# Altium schematic sheet RS485-UART.SchDoc
size 420 x 297 mm; SheetNumber: 4; SheetTotal: 4
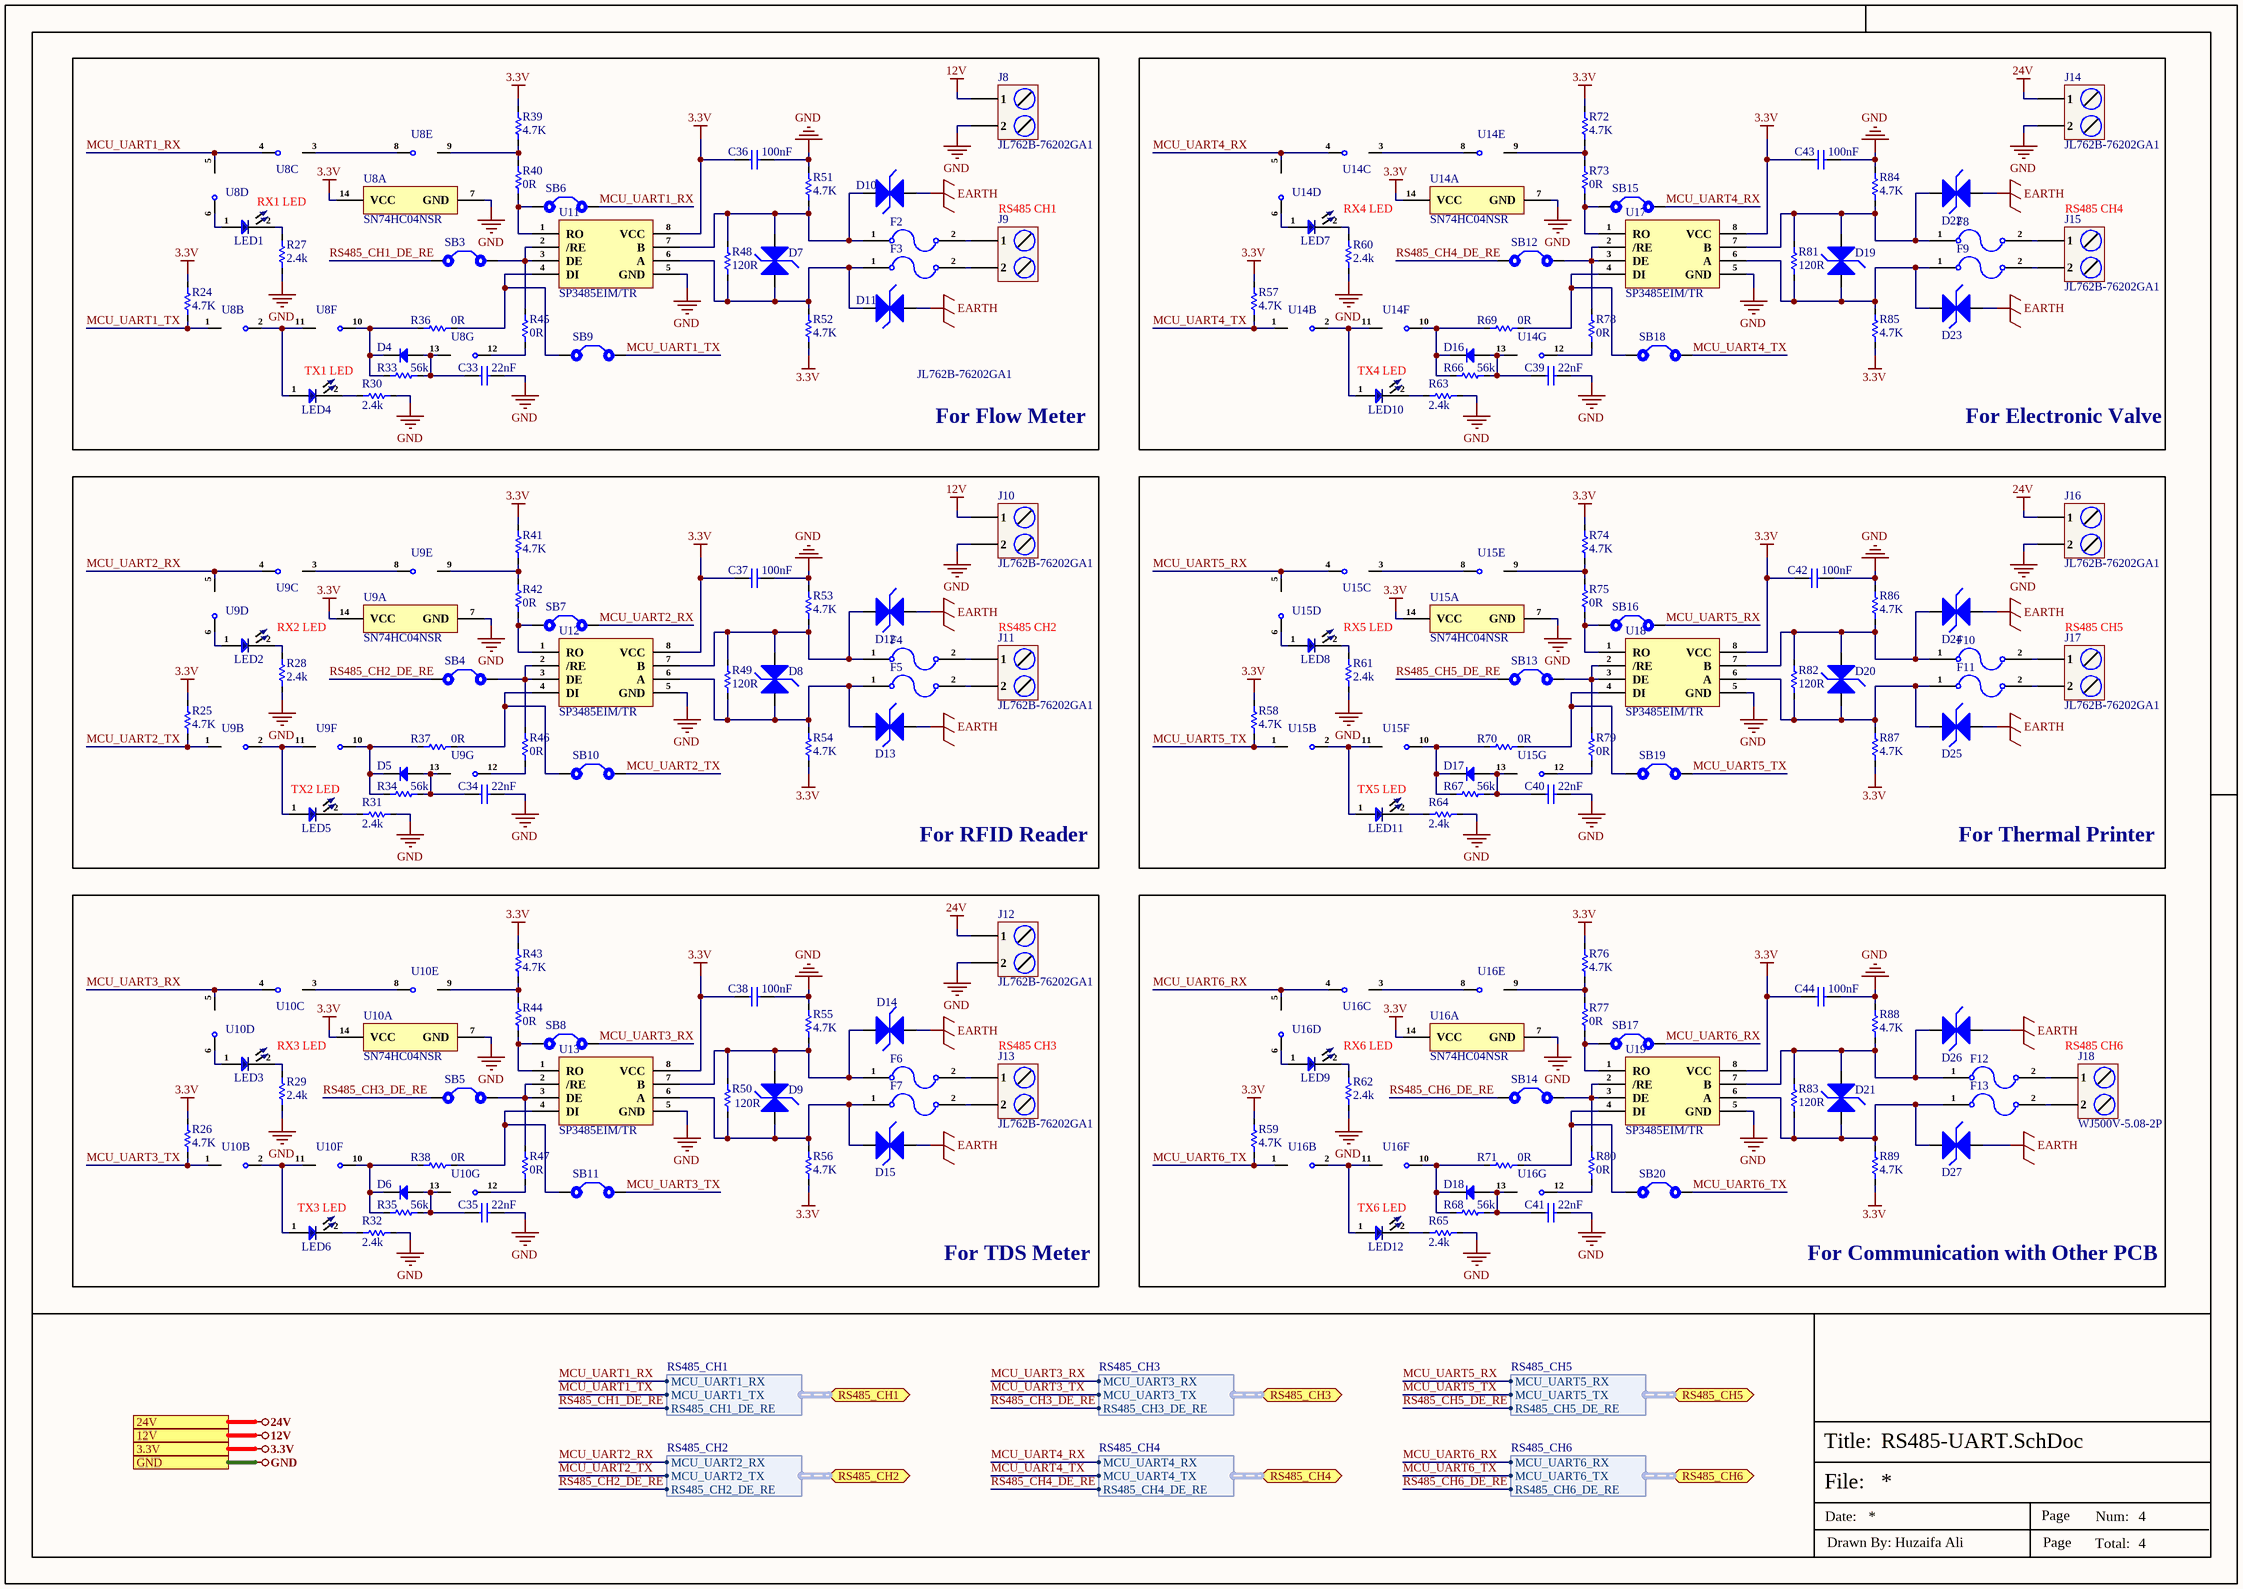
[diagram p0: RS485-UART.SchDoc]

## Parts
C33  22nF  [Cap-0402]
C34  22nF  [Cap-0402]
C35  22nF  [Cap-0402]
C36  100nF  [Cap-0603]
C37  100nF  [Cap-0603]
C38  100nF  [Cap-0603]
C39  22nF  [Cap-0402]
C40  22nF  [Cap-0402]
C41  22nF  [Cap-0402]
C42  100nF  [Cap-0603]
C43  100nF  [Cap-0603]
C44  100nF  [Cap-0603]
D4  1N4148W-7-F  [SOD-123]  (value not drawn)
D5  1N4148W-7-F  [SOD-123]  (value not drawn)
D6  1N4148W-7-F  [SOD-123]  (value not drawn)
D7  SMAJ6.5CA  [SMA]  (value not drawn)
D8  SMAJ6.5CA  [SMA]  (value not drawn)
D9  SMAJ6.5CA  [SMA]  (value not drawn)
D10  SMAJ6.5CA  [SMA]  (value not drawn)
D11  SMAJ6.5CA  [SMA]  (value not drawn)
D12  SMAJ6.5CA  [SMA]  (value not drawn)
D13  SMAJ6.5CA  [SMA]  (value not drawn)
D14  SMAJ6.5CA  [SMA]  (value not drawn)
D15  SMAJ6.5CA  [SMA]  (value not drawn)
D16  1N4148W-7-F  [SOD-123]  (value not drawn)
D17  1N4148W-7-F  [SOD-123]  (value not drawn)
D18  1N4148W-7-F  [SOD-123]  (value not drawn)
D19  SMAJ6.5CA  [SMA]  (value not drawn)
D20  SMAJ6.5CA  [SMA]  (value not drawn)
D21  SMAJ6.5CA  [SMA]  (value not drawn)
D22  SMAJ6.5CA  [SMA]  (value not drawn)
D23  SMAJ6.5CA  [SMA]  (value not drawn)
D24  SMAJ6.5CA  [SMA]  (value not drawn)
D25  SMAJ6.5CA  [SMA]  (value not drawn)
D26  SMAJ6.5CA  [SMA]  (value not drawn)
D27  SMAJ6.5CA  [SMA]  (value not drawn)
F2  MF-MSMF010-2  [Fuse-1812_]  (value not drawn)
F3  MF-MSMF010-2  [Fuse-1812_]  (value not drawn)
F4  MF-MSMF010-2  [Fuse-1812_]  (value not drawn)
F5  MF-MSMF010-2  [Fuse-1812_]  (value not drawn)
F6  MF-MSMF010-2  [Fuse-1812_]  (value not drawn)
F7  MF-MSMF010-2  [Fuse-1812_]  (value not drawn)
F8  MF-MSMF010-2  [Fuse-1812_]  (value not drawn)
F9  MF-MSMF010-2  [Fuse-1812_]  (value not drawn)
F10  MF-MSMF010-2  [Fuse-1812_]  (value not drawn)
F11  MF-MSMF010-2  [Fuse-1812_]  (value not drawn)
F12  MF-MSMF010-2  [Fuse-1812_]  (value not drawn)
F13  MF-MSMF010-2  [Fuse-1812_]  (value not drawn)
J8  JL762B-76202GA1  [JL762B-76202GA1]
J9  JL762B-76202GA1  [JL762B-76202GA1]
J10  JL762B-76202GA1  [JL762B-76202GA1]
J11  JL762B-76202GA1  [JL762B-76202GA1]
J12  JL762B-76202GA1  [JL762B-76202GA1]
J13  JL762B-76202GA1  [JL762B-76202GA1]
J14  JL762B-76202GA1  [JL762B-76202GA1]
J15  JL762B-76202GA1  [JL762B-76202GA1]
J16  JL762B-76202GA1  [JL762B-76202GA1]
J17  JL762B-76202GA1  [JL762B-76202GA1]
J18  WJ500V-5.08-2P  [Terminal Block 2P_]
LED1  Emerald  [LED-0603]  (value not drawn)
LED2  Emerald  [LED-0603]  (value not drawn)
LED3  Emerald  [LED-0603]  (value not drawn)
LED4  Emerald  [LED-0603]  (value not drawn)
LED5  Emerald  [LED-0603]  (value not drawn)
LED6  Emerald  [LED-0603]  (value not drawn)
LED7  Emerald  [LED-0603]  (value not drawn)
LED8  Emerald  [LED-0603]  (value not drawn)
LED9  Emerald  [LED-0603]  (value not drawn)
LED10  Emerald  [LED-0603]  (value not drawn)
LED11  Emerald  [LED-0603]  (value not drawn)
LED12  Emerald  [LED-0603]  (value not drawn)
R24  4.7K  [Res-0402]
R25  4.7K  [Res-0402]
R26  4.7K  [Res-0402]
R27  2.4k  [Res-0402]
R28  2.4k  [Res-0402]
R29  2.4k  [Res-0402]
R30  2.4k  [Res-0402]
R31  2.4k  [Res-0402]
R32  2.4k  [Res-0402]
R33  56k  [Res-0402]
R34  56k  [Res-0402]
R35  56k  [Res-0402]
R36  0R  [Res-0402]
R37  0R  [Res-0402]
R38  0R  [Res-0402]
R39  4.7K  [Res-0402]
R40  0R  [Res-0402]
R41  4.7K  [Res-0402]
R42  0R  [Res-0402]
R43  4.7K  [Res-0402]
R44  0R  [Res-0402]
R45  0R  [Res-0402]
R46  0R  [Res-0402]
R47  0R  [Res-0402]
R48  120R  [Res-0603]
R49  120R  [Res-0603]
R50  120R  [Res-0603]
R51  4.7K  [Res-0402]
R52  4.7K  [Res-0402]
R53  4.7K  [Res-0402]
R54  4.7K  [Res-0402]
R55  4.7K  [Res-0402]
R56  4.7K  [Res-0402]
R57  4.7K  [Res-0402]
R58  4.7K  [Res-0402]
R59  4.7K  [Res-0402]
R60  2.4k  [Res-0402]
R61  2.4k  [Res-0402]
R62  2.4k  [Res-0402]
R63  2.4k  [Res-0402]
R64  2.4k  [Res-0402]
R65  2.4k  [Res-0402]
R66  56k  [Res-0402]
R67  56k  [Res-0402]
R68  56k  [Res-0402]
R69  0R  [Res-0402]
R70  0R  [Res-0402]
R71  0R  [Res-0402]
R72  4.7K  [Res-0402]
R73  0R  [Res-0402]
R74  4.7K  [Res-0402]
R75  0R  [Res-0402]
R76  4.7K  [Res-0402]
R77  0R  [Res-0402]
R78  0R  [Res-0402]
R79  0R  [Res-0402]
R80  0R  [Res-0402]
R81  120R  [Res-0603]
R82  120R  [Res-0603]
R83  120R  [Res-0603]
R84  4.7K  [Res-0402]
R85  4.7K  [Res-0402]
R86  4.7K  [Res-0402]
R87  4.7K  [Res-0402]
R88  4.7K  [Res-0402]
R89  4.7K  [Res-0402]
SB3  Solder Bridge 0402  [Solder Bridge 0402]  (value not drawn)
SB4  Solder Bridge 0402  [Solder Bridge 0402]  (value not drawn)
SB5  Solder Bridge 0402  [Solder Bridge 0402]  (value not drawn)
SB6  Solder Bridge 0402  [Solder Bridge 0402]  (value not drawn)
SB7  Solder Bridge 0402  [Solder Bridge 0402]  (value not drawn)
SB8  Solder Bridge 0402  [Solder Bridge 0402]  (value not drawn)
SB9  Solder Bridge 0402  [Solder Bridge 0402]  (value not drawn)
SB10  Solder Bridge 0402  [Solder Bridge 0402]  (value not drawn)
SB11  Solder Bridge 0402  [Solder Bridge 0402]  (value not drawn)
SB12  Solder Bridge 0402  [Solder Bridge 0402]  (value not drawn)
SB13  Solder Bridge 0402  [Solder Bridge 0402]  (value not drawn)
SB14  Solder Bridge 0402  [Solder Bridge 0402]  (value not drawn)
SB15  Solder Bridge 0402  [Solder Bridge 0402]  (value not drawn)
SB16  Solder Bridge 0402  [Solder Bridge 0402]  (value not drawn)
SB17  Solder Bridge 0402  [Solder Bridge 0402]  (value not drawn)
SB18  Solder Bridge 0402  [Solder Bridge 0402]  (value not drawn)
SB19  Solder Bridge 0402  [Solder Bridge 0402]  (value not drawn)
SB20  Solder Bridge 0402  [Solder Bridge 0402]  (value not drawn)
U8  SN74HC04NSR  [14-SOIC]  (parts A,B,C,D,E,F,G of 7)
U9  SN74HC04NSR  [14-SOIC]  (parts A,B,C,D,E,F,G of 7)
U10  SN74HC04NSR  [14-SOIC]  (parts A,B,C,D,E,F,G of 7)
U11  SP3485EIM/TR  [SOP-8]
U12  SP3485EIM/TR  [SOP-8]
U13  SP3485EIM/TR  [SOP-8]
U14  SN74HC04NSR  [14-SOIC]  (parts A,B,C,D,E,F,G of 7)
U15  SN74HC04NSR  [14-SOIC]  (parts A,B,C,D,E,F,G of 7)
U16  SN74HC04NSR  [14-SOIC]  (parts A,B,C,D,E,F,G of 7)
U17  SP3485EIM/TR  [SOP-8]
U18  SP3485EIM/TR  [SOP-8]
U19  SP3485EIM/TR  [SOP-8]

## Blocks framed on the sheet
For Flow Meter: C33 C36 D4 D7 D10 D11 F2 F3 J8 J9 LED1 LED4 R24 R27 R30 R33 R36 R39 R40 R45 R48 R51 R52 SB3 SB6 SB9 U8 U11
For Electronic Valve: C39 C43 D16 D19 D22 D23 F8 F9 J14 J15 LED7 LED10 R57 R60 R63 R66 R69 R72 R73 R78 R81 R84 R85 SB12 SB15 SB18 U14 U17
For RFID Reader: C34 C37 D5 D8 D12 D13 F4 F5 J10 J11 LED2 LED5 R25 R28 R31 R34 R37 R41 R42 R46 R49 R53 R54 SB4 SB7 SB10 U9 U12
For Thermal Printer: C40 C42 D17 D20 D24 D25 F10 F11 J16 J17 LED8 LED11 R58 R61 R64 R67 R70 R74 R75 R79 R82 R86 R87 SB13 SB16 SB19 U15 U18
For TDS Meter: C35 C38 D6 D9 D14 D15 F6 F7 J12 J13 LED3 LED6 R26 R29 R32 R35 R38 R43 R44 R47 R50 R55 R56 SB5 SB8 SB11 U10 U13
For Communication with Other PCB: C41 C44 D18 D21 D26 D27 F12 F13 J18 LED9 LED12 R59 R62 R65 R68 R71 R76 R77 R80 R83 R88 R89 SB14 SB17 SB20 U16 U19

## Ports
3.3V, 12V, 24V, GND, RS485_CH1 (bidir, harness RS485_CH1), RS485_CH2 (bidir, harness RS485_CH2), RS485_CH3 (bidir, harness RS485_CH3), RS485_CH4 (bidir, harness RS485_CH4), RS485_CH5 (bidir, harness RS485_CH5), RS485_CH6 (bidir, harness RS485_CH6)

## Harnesses
RS485_CH1: MCU_UART1_RX, MCU_UART1_TX, RS485_CH1_DE_RE
RS485_CH2: MCU_UART2_RX, MCU_UART2_TX, RS485_CH2_DE_RE
RS485_CH3: MCU_UART3_RX, MCU_UART3_TX, RS485_CH3_DE_RE
RS485_CH4: MCU_UART4_RX, MCU_UART4_TX, RS485_CH4_DE_RE
RS485_CH5: MCU_UART5_RX, MCU_UART5_TX, RS485_CH5_DE_RE
RS485_CH6: MCU_UART6_RX, MCU_UART6_TX, RS485_CH6_DE_RE

## Nets
3.3V: C36.2 C37.2 C38.2 C42.2 C43.2 C44.2 R24.2 R25.2 R26.2 R39.2 R41.2 R43.2 R52.1 R54.1 R56.1 R57.2 R58.2 R59.2 R72.2 R74.2 R76.2 R85.1 R87.1 R89.1 U8.14(VCC) U9.14(VCC) U10.14(VCC) U11.8(VCC) U12.8(VCC) U13.8(VCC) U14.14(VCC) U15.14(VCC) U16.14(VCC) U17.8(VCC) U18.8(VCC) U19.8(VCC) ; port 3.3V
12V: J8.1 J10.1 ; port 12V
24V: J12.1 J14.1 J16.1 ; port 24V
EARTH: D10.1(A) D11.1(A) D12.1(A) D13.1(A) D14.1(A) D15.1(A) D22.1(A) D23.1(A) D24.1(A) D25.1(A) D26.1(A) D27.1(A)
GND: C33.1 C34.1 C35.1 C36.1 C37.1 C38.1 C39.1 C40.1 C41.1 C42.1 C43.1 C44.1 J8.2 J10.2 J12.2 J14.2 J16.2 R27.1 R28.1 R29.1 R30.1 R31.1 R32.1 R51.2 R53.2 R55.2 R60.1 R61.1 R62.1 R63.1 R64.1 R65.1 R84.2 R86.2 R88.2 U8.7(GND) U9.7(GND) U10.7(GND) U11.5(GND) U12.5(GND) U13.5(GND) U14.7(GND) U15.7(GND) U16.7(GND) U17.5(GND) U18.5(GND) U19.5(GND) ; port GND
MCU_UART1_RX: SB6.2 U8.4(2Y) U8.5(3A) ; port RS485_CH1.MCU_UART1_RX
MCU_UART1_TX: R24.1 SB9.2 U8.1(1A) ; port RS485_CH1.MCU_UART1_TX
MCU_UART2_RX: SB7.2 U9.4(2Y) U9.5(3A) ; port RS485_CH2.MCU_UART2_RX
MCU_UART2_TX: R25.1 SB10.2 U9.1(1A) ; port RS485_CH2.MCU_UART2_TX
MCU_UART3_RX: SB8.2 U10.4(2Y) U10.5(3A) ; port RS485_CH3.MCU_UART3_RX
MCU_UART3_TX: R26.1 SB11.2 U10.1(1A) ; port RS485_CH3.MCU_UART3_TX
MCU_UART4_RX: SB15.2 U14.4(2Y) U14.5(3A) ; port RS485_CH4.MCU_UART4_RX
MCU_UART4_TX: R57.1 SB18.2 U14.1(1A) ; port RS485_CH4.MCU_UART4_TX
MCU_UART5_RX: SB16.2 U15.4(2Y) U15.5(3A) ; port RS485_CH5.MCU_UART5_RX
MCU_UART5_TX: R58.1 SB19.2 U15.1(1A) ; port RS485_CH5.MCU_UART5_TX
MCU_UART6_RX: SB17.2 U16.4(2Y) U16.5(3A) ; port RS485_CH6.MCU_UART6_RX
MCU_UART6_TX: R59.1 SB20.2 U16.1(1A) ; port RS485_CH6.MCU_UART6_TX
RS485_CH1_DE_RE: SB3.1 ; port RS485_CH1.RS485_CH1_DE_RE
RS485_CH2_DE_RE: SB4.1 ; port RS485_CH2.RS485_CH2_DE_RE
RS485_CH3_DE_RE: SB5.1 ; port RS485_CH3.RS485_CH3_DE_RE
RS485_CH4_DE_RE: SB12.1 ; port RS485_CH4.RS485_CH4_DE_RE
RS485_CH5_DE_RE: SB13.1 ; port RS485_CH5.RS485_CH5_DE_RE
RS485_CH6_DE_RE: SB14.1 ; port RS485_CH6.RS485_CH6_DE_RE
NetC33_2: C33.2 D4.1(A) R33.2 U8.13(6A)
NetC34_2: C34.2 D5.1(A) R34.2 U9.13(6A)
NetC35_2: C35.2 D6.1(A) R35.2 U10.13(6A)
NetC39_2: C39.2 D16.1(A) R66.2 U14.13(6A)
NetC40_2: C40.2 D17.1(A) R67.2 U15.13(6A)
NetC41_2: C41.2 D18.1(A) R68.2 U16.13(6A)
NetD4_2: D4.2(K) R33.1 R36.2 U8.10(5Y)
NetD5_2: D5.2(K) R34.1 R37.2 U9.10(5Y)
NetD6_2: D6.2(K) R35.1 R38.2 U10.10(5Y)
NetD7_1: D7.1(A) D11.2(A) F3.1 R48.1 R52.2 U11.6(A)
NetD7_2: D7.2(A) D10.2(A) F2.1 R48.2 R51.1 U11.7(B)
NetD8_1: D8.1(A) D13.2(A) F5.1 R49.1 R54.2 U12.6(A)
NetD8_2: D8.2(A) D12.2(A) F4.1 R49.2 R53.1 U12.7(B)
NetD9_1: D9.1(A) D15.2(A) F7.1 R50.1 R56.2 U13.6(A)
NetD9_2: D9.2(A) D14.2(A) F6.1 R50.2 R55.1 U13.7(B)
NetD16_2: D16.2(K) R66.1 R69.2 U14.10(5Y)
NetD17_2: D17.2(K) R67.1 R70.2 U15.10(5Y)
NetD18_2: D18.2(K) R68.1 R71.2 U16.10(5Y)
NetD19_1: D19.1(A) D23.2(A) F9.1 R81.1 R85.2 U17.6(A)
NetD19_2: D19.2(A) D22.2(A) F8.1 R81.2 R84.1 U17.7(B)
NetD20_1: D20.1(A) D25.2(A) F11.1 R82.1 R87.2 U18.6(A)
NetD20_2: D20.2(A) D24.2(A) F10.1 R82.2 R86.1 U18.7(B)
NetD21_1: D21.1(A) D27.2(A) F13.1 R83.1 R89.2 U19.6(A)
NetD21_2: D21.2(A) D26.2(A) F12.1 R83.2 R88.1 U19.7(B)
NetF2_2: F2.2 J9.1
NetF3_2: F3.2 J9.2
NetF4_2: F4.2 J11.1
NetF5_2: F5.2 J11.2
NetF6_2: F6.2 J13.1
NetF7_2: F7.2 J13.2
NetF8_2: F8.2 J15.1
NetF9_2: F9.2 J15.2
NetF10_2: F10.2 J17.1
NetF11_2: F11.2 J17.2
NetF12_2: F12.2 J18.1
NetF13_2: F13.2 J18.2
NetLED1_1: LED1.1 U8.6(3Y)
NetLED1_2: LED1.2 R27.2
NetLED2_1: LED2.1 U9.6(3Y)
NetLED2_2: LED2.2 R28.2
NetLED3_1: LED3.1 U10.6(3Y)
NetLED3_2: LED3.2 R29.2
NetLED4_1: LED4.1 U8.2(1Y) U8.11(5A)
NetLED4_2: LED4.2 R30.2
NetLED5_1: LED5.1 U9.2(1Y) U9.11(5A)
NetLED5_2: LED5.2 R31.2
NetLED6_1: LED6.1 U10.2(1Y) U10.11(5A)
NetLED6_2: LED6.2 R32.2
NetLED7_1: LED7.1 U14.6(3Y)
NetLED7_2: LED7.2 R60.2
NetLED8_1: LED8.1 U15.6(3Y)
NetLED8_2: LED8.2 R61.2
NetLED9_1: LED9.1 U16.6(3Y)
NetLED9_2: LED9.2 R62.2
NetLED10_1: LED10.1 U14.2(1Y) U14.11(5A)
NetLED10_2: LED10.2 R63.2
NetLED11_1: LED11.1 U15.2(1Y) U15.11(5A)
NetLED11_2: LED11.2 R64.2
NetLED12_1: LED12.1 U16.2(1Y) U16.11(5A)
NetLED12_2: LED12.2 R65.2
NetR36_1: R36.1 SB9.1 U11.4(DI)
NetR37_1: R37.1 SB10.1 U12.4(DI)
NetR38_1: R38.1 SB11.1 U13.4(DI)
NetR39_1: R39.1 R40.1 U8.9(4A)
NetR40_2: R40.2 SB6.1 U11.1(RO)
NetR41_1: R41.1 R42.1 U9.9(4A)
NetR42_2: R42.2 SB7.1 U12.1(RO)
NetR43_1: R43.1 R44.1 U10.9(4A)
NetR44_2: R44.2 SB8.1 U13.1(RO)
NetR45_1: R45.1 U8.12(6Y)
NetR45_2: R45.2 SB3.2 U11.2(/RE) U11.3(DE)
NetR46_1: R46.1 U9.12(6Y)
NetR46_2: R46.2 SB4.2 U12.2(/RE) U12.3(DE)
NetR47_1: R47.1 U10.12(6Y)
NetR47_2: R47.2 SB5.2 U13.2(/RE) U13.3(DE)
NetR69_1: R69.1 SB18.1 U17.4(DI)
NetR70_1: R70.1 SB19.1 U18.4(DI)
NetR71_1: R71.1 SB20.1 U19.4(DI)
NetR72_1: R72.1 R73.1 U14.9(4A)
NetR73_2: R73.2 SB15.1 U17.1(RO)
NetR74_1: R74.1 R75.1 U15.9(4A)
NetR75_2: R75.2 SB16.1 U18.1(RO)
NetR76_1: R76.1 R77.1 U16.9(4A)
NetR77_2: R77.2 SB17.1 U19.1(RO)
NetR78_1: R78.1 U14.12(6Y)
NetR78_2: R78.2 SB12.2 U17.2(/RE) U17.3(DE)
NetR79_1: R79.1 U15.12(6Y)
NetR79_2: R79.2 SB13.2 U18.2(/RE) U18.3(DE)
NetR80_1: R80.1 U16.12(6Y)
NetR80_2: R80.2 SB14.2 U19.2(/RE) U19.3(DE)
NetU8_3: U8.3(2A) U8.8(4Y)
NetU9_3: U9.3(2A) U9.8(4Y)
NetU10_3: U10.3(2A) U10.8(4Y)
NetU14_3: U14.3(2A) U14.8(4Y)
NetU15_3: U15.3(2A) U15.8(4Y)
NetU16_3: U16.3(2A) U16.8(4Y)

## Notes on the sheet
- RX1 LED
- (near J9) RS485 CH1
- RX4 LED
- (near J15) RS485 CH4
- TX1 LED
- TX4 LED
- RX2 LED
- (near J11) RS485 CH2
- RX5 LED
- (near J17) RS485 CH5
- TX2 LED
- TX5 LED
- RX3 LED
- (near J13) RS485 CH3
- RX6 LED
- (near J18) RS485 CH6
- TX3 LED
- TX6 LED
- File:
- Title:
- Date:
- Page
- Num:
- Total:
- Drawn By: Huzaifa Ali

## Library data of the parts
C33-C35 C39-C41 = CC0402KRX5R7BB223: CAP CER 0.022UF 16V X5R 0402; Manufacturer: Yageo; Tolerance: 10%; Supplier 1: Mouser; Manufacturer Part Number: CC0402KRX5R7BB223; RoHS: Yes; Category: Ceramic Capacitors; Stock 1: 31160; Pricing 1: 1=0.10000, 10=0.05600, 50=0.05600, 100=0.02500, 1000=0.01400, 10000=0.01000 (USD); Mount: Surface Mount; Case/Package: 0402; Case Code (Metric): 1005; Case Code (Imperial): 0402; Min Operating Temperature: -55°C; Max Operating Temperature: 85°C; Packaging: Tape and Reel; Capacitance: 22nF; Voltage Rating: 16V; Voltage Rating (DC): 16V; Dielectric: X5R; Length: 0.039inch; Width: 0.02inch; Thickness: 0.022inch; Lead Free: Lead Free; Halogen Free: Halogen Free; RoHS Compliant: Yes; ComponentLink1URL: http://www.yageo.com/exep/pages/download/literatures/ProductSelectionGuide%202014_Final_2.pdf?src-supplier=Digi-Key; ComponentLink1Description: http://www.yageo.com/exep/pages/download/literatures/ProductSelectionGuide%202014_Final_2.pdf?src-supplier=Digi-Key; ComponentLink2URL: http://www.yageo.com/documents/recent/UPY-GPHC_X5R_4V-to-50V_25.pdf?src-supplier=Digi-Key; ComponentLink2Description: http://www.yageo.com/documents/recent/UPY-GPHC_X5R_4V-to-50V_25.pdf?src-supplier=Digi-Key; Supplier Part Number 1: 603-CC402KRX5R7BB223; LCSC Part Number: C541399
C36-C38 C42-C44 = CC0603KRX5R9BB104: CAP CER 0.1UF 50V X5R 0603; Manufacturer: Yageo; Tolerance: 10%; Item Type: Capacitor; Supplier 1: Digi-Key; Manufacturer Part Number: CC0603KRX5R9BB104; RoHS: Yes; Category: Ceramic Capacitors; Stock 1: 152253; Pricing 1: 1=0.10000, 10=0.05200, 50=0.02820, 100=0.02310, 500=0.01648, 1000=0.01294 (USD); Mount: Surface Mount; Case/Package: 0603; Case Code (Imperial): 0603; Case Code (Metric): 1608; Weight: 7.1E-05oz; Min Operating Temperature: -55°C; Max Operating Temperature: 85°C; Capacitance: 100nF; Packaging: Tape and Reel; Voltage Rating: 50V; Dielectric: X5R; Termination: SMD/SMT; Voltage Rating (DC): 50V; Package Quantity: 4000; Length: 0.063inch; Width: 0.031inch; Thickness: 0.035inch; Lead Free: Lead Free; Halogen Free: Halogen Free; ComponentLink1URL: http://www.mouser.com/ds/2/447/Yageo_UPY-GP_NP0_16V-to-50V_9-358835.pdf?src-supplier=Mouser; ComponentLink1Description: http://www.mouser.com/ds/2/447/Yageo_UPY-GP_NP0_16V-to-50V_9-358835.pdf?src-supplier=Mouser; ComponentLink2URL: https://www.yageo.com/upload/media/product/productsearch/datasheet/mlcc/UPY-GPHC_X5R_4V-to-50V_26.pdf?src-supplier=Digi-Key; ComponentLink2Description: https://www.yageo.com/upload/media/product/productsearch/datasheet/mlcc/UPY-GPHC_X5R_4V-to-50V_26.pdf?src-supplier=Digi-Key; ComponentLink3URL: http://www.yageo.com/exep/pages/download/literatures/ProductSelectionGuide%202014_Final_2.pdf?src-supplier=Digi-Key; ComponentLink3Description: http://www.yageo.com/exep/pages/download/literatures/ProductSelectionGuide%202014_Final_2.pdf?src-supplier=Digi-Key; Supplier Part Number 1: 311-4046-1-ND; LCSC Part Number: C110022
D4-D6 D16-D18 = 1N4148W-7-F: DIODE GEN PURP 100V 300MA SOD123; Manufacturer: Diodes; Forward Current: 150mA; Reverse Recovery Time: 4ns; Max Forward Surge Current (Ifsm): 2A; Element Configuration: Single; Max Reverse Current: 1uA; Forward Voltage: 1.25V; Power Dissipation: 400mW; Polarity: Standard; Voltage Rating (DC): 75V; Value: 2pF; Supplier 1: Future Electronics; Manufacturer Part Number: 1N4148W-7-F; RoHS: Yes; Category: Rectifier Diodes; Stock 1: 32931000; Pricing 1: 3000=0.01840, 12000=0.01760, 45000=0.01690, 120000=0.01640, 300000=0.01560 (USD); Mounting Technology: Surface Mount; Pins: 2; Weight: 0.000353oz; Contact Plating: Tin,Matte; Min Operating Temperature: -65°C; Max Operating Temperature: 150°C; Packaging: Tape and Reel; Max Repetitive Reverse Voltage (Vrrm): 100V; Peak Non-Repetitive Surge Current: 2A; Voltage: 100V; Max Surge Current: 2A; Package Quantity: 3000; Recovery Time: 4ns; Average Rectified Current: 300mA; Power Rating: 400mW; Current Rating: 150mA; Output Current: 150mA; Max Reverse Voltage (DC): 100V; Series: -; Reverse Recovery Time-Max: 4ns; Length: 2.85mm; Width: 1.7mm; Height: 1.25mm; Radiation Hardening: No; RoHS Compliant: Yes; Reach SVHC Compliant: Yes; Lead Free: Lead Free; ComponentLink1URL: https://datasheet.ciiva.com/1179/1915529-1179304.pdf?src-supplier=Element14; ComponentLink1Description: https://datasheet.ciiva.com/1179/1915529-1179304.pdf?src-supplier=Element14; ComponentLink2URL: https://datasheet.ciiva.com/22695/1915529-22695239.pdf?src-supplier=Element14; ComponentLink2Description: https://datasheet.ciiva.com/22695/1915529-22695239.pdf?src-supplier=Element14; ComponentLink3URL: https://datasheet.ciiva.com/8300/ds30086-8300392.pdf?src-supplier=Avnet; ComponentLink3Description: https://datasheet.ciiva.com/8300/ds30086-8300392.pdf?src-supplier=Avnet; ComponentLink4URL: https://datasheet.ciiva.com/15219/getdatasheetpartid-110030-15219548.pdf?src-supplier=Verical; ComponentLink4Description: https://datasheet.ciiva.com/15219/getdatasheetpartid-110030-15219548.pdf?src-supplier=Verical; ComponentLink5URL: https://datasheet.ciiva.com/8303/ds30086-8303197.pdf?src-supplier=Avnet; ComponentLink5Description: https://datasheet.ciiva.com/8303/ds30086-8303197.pdf?src-supplier=Avnet; ComponentLink6URL: https://datasheet.ciiva.com/911/ds30086-911735.pdf?src-supplier=Digi-Key; ComponentLink6Description: https://datasheet.ciiva.com/911/ds30086-911735.pdf?src-supplier=Digi-Key; ComponentLink7URL: https://datasheet.ciiva.com/911/ds30086-911736.pdf?src-supplier=Digi-Key; ComponentLink7Description: https://datasheet.ciiva.com/911/ds30086-911736.pdf?src-supplier=Digi-Key; ComponentLink8URL: https://datasheet.ciiva.com/911/ds30086-911734.pdf?src-supplier=Digi-Key; ComponentLink8Description: https://datasheet.ciiva.com/911/ds30086-911734.pdf?src-supplier=Digi-Key; ComponentLink9URL: https://datasheet.ciiva.com/4435/ds30086-4435128.pdf?src-supplier=Mouser; ComponentLink9Description: https://datasheet.ciiva.com/4435/ds30086-4435128.pdf?src-supplier=Mouser; Supplier Part Number 1: 7634694; LCSC Part Number: C83528; Item Type: Diode
D7-D15 D19-D27 = SMAJ6.5CA: TVS DIODE 6.5VWM 11.2VC DO214AC; Manufacturer: Littelfuse; Reverse Standoff Voltage: 6.5V; Min Breakdown Voltage: 7.22V; Polarity: Bidirectional; Peak Pulse Current: 35.7A; Peak Pulse Power: 400W; Test Current: 10mA; Number of Bidirectional Channels: 1; Clamping Voltage: 11.2V; Power Line Protection: No; Diode Type: ZENER; Max Breakdown Voltage: 7.98V; Max Power Dissipation: 3.3W; Leakage Current: 1mA; Supplier 1: Arrow Electronics; Manufacturer Part Number: SMAJ6.5CA; RoHS: Yes; Category: TVS Diodes; Stock 1: 45000; Pricing 1: 5000=0.0893, 10000=0.0814, 25000=0.0761, 50000=0.0683, 125000=0.0656 (USD); Mounting Technology: Surface Mount; Case/Package: DO-214AC; Pins: 2; Min Operating Temperature: -65°C; Max Operating Temperature: 150°C; Packaging: Tape and Reel; Breakdown Voltage: 7.22V; Package Quantity: 5000; Max Surge Current: 35.7A; Series: SMAJ; Direction: Bidirectional; Operating Supply Voltage: 6.5V; Number of Channels: 1; Termination: SMD/SMT; Voltage Rating (DC): 6.5V; Reverse Breakdown Voltage: 7.22V; Number of Elements: 1; Power Dissipation: 400W; Clamping Voltage-Max: 11.2V; Length: 5.28mm; Width: 2.79mm; Height: 2.29mm; RoHS Compliant: Yes; Lead Free: Lead Free; Reach SVHC Compliant: No; ComponentLink1URL: https://datasheet.ciiva.com/340/littelfuse-tvs-diode-smaj-datasheet-pdf-340656.pdf?src-supplier=Digi-Key; ComponentLink1Description: https://datasheet.ciiva.com/340/littelfuse-tvs-diode-smaj-datasheet-pdf-340656.pdf?src-supplier=Digi-Key; ComponentLink2URL: https://datasheet.ciiva.com/340/littelfuse-tvs-diode-smaj-datasheet-pdf-340657.pdf?src-supplier=Digi-Key; ComponentLink2Description: https://datasheet.ciiva.com/340/littelfuse-tvs-diode-smaj-datasheet-pdf-340657.pdf?src-supplier=Digi-Key; ComponentLink3URL: https://datasheet.ciiva.com/16391/littelfuse-tvs-diode-smaj-16391802.pdf?src-supplier=Future+Electronics; ComponentLink3Description: https://datasheet.ciiva.com/16391/littelfuse-tvs-diode-smaj-16391802.pdf?src-supplier=Future+Electronics; ComponentLink4URL: https://datasheet.ciiva.com/340/littelfuse-tvs-diode-smaj-datasheet-pdf-340655.pdf?src-supplier=Digi-Key; ComponentLink4Description: https://datasheet.ciiva.com/340/littelfuse-tvs-diode-smaj-datasheet-pdf-340655.pdf?src-supplier=Digi-Key; Supplier Part Number 1: SMAJ6.5CA; LCSC Part Number: C83330; Item Type: Diode
F2-F13 = MF-MSMF010-2: 60V 100mA 40A 300mA 1812 Resettable Fuses ROHS; Manufacturer: Bourns; Time to Trip: 1.5s; Item Type: Fuse; Supplier 1: Arrow Electronics; Manufacturer Part Number: MF-MSMF010-2; RoHS: Yes; Category: Fuses; Stock 1: 75000; Pricing 1: 3000=0.1392 (USD); Mounting Technology: Surface Mount; Case Code (Imperial): 1812; Case Code (Metric): 4532; Min Operating Temperature: -40°C; Max Operating Temperature: 85°C; Packaging: Cut Tape; Max Current Rating: 40A; Hold Current: 100mA; Trip Current: 300mA; Series: Multifuse®, MF-MSMF; Voltage Rating: 60V; Ratings: AEC-Q200; RoHS Compliant: Yes; ComponentLink1URL: http://www.farnell.com/datasheets/2264697.pdf?src-supplier=Farnell; ComponentLink1Description: http://www.farnell.com/datasheets/2264697.pdf?src-supplier=Farnell; ComponentLink2URL: http://www.farnell.com/datasheets/2264697.pdf?src-supplier=Newark; ComponentLink2Description: http://www.farnell.com/datasheets/2264697.pdf?src-supplier=Newark; ComponentLink3URL: http://www.farnell.com/datasheets/2264697.pdf?src-supplier=Element14; ComponentLink3Description: http://www.farnell.com/datasheets/2264697.pdf?src-supplier=Element14; ComponentLink4URL: http://www.farnell.com/datasheets/1786007.pdf?src-supplier=Newark; ComponentLink4Description: http://www.farnell.com/datasheets/1786007.pdf?src-supplier=Newark; ComponentLink5URL: https://www.bourns.com/docs/Product-Datasheets/mfmsmf.pdf?src-supplier=Digi-Key; ComponentLink5Description: https://www.bourns.com/docs/Product-Datasheets/mfmsmf.pdf?src-supplier=Digi-Key; Supplier Part Number 1: MF-MSMF010-2; LCSC Part Number: C12430
J8-J17 = JL762B-76202GA1: -40℃~+105℃ 20A 300V Green Corner pin Double - Walled(Double) 14~22 Straight pin 2 1 7.62mm Plugin,P=7.62mm Barrier Terminal Blocks ROHS; Manufacturer: JILN; Manufacturer Part Number: JL762B-76202GA1; Package: Plugin,P=7.62mm; LCSC Part Number: C394551; Item Type: Terminal Block; ComponentLink1Description: LCSC; ComponentLink1URL: https://www.lcsc.com/product-detail/Barrier-Terminal-Blocks_JILN-JL762B-76202GA1_C394551.html
J18 = Terminal Block 2POS: 2.5 18A Green Straight pin 5.08mm 1 14~30 2 Straight,P=5.08mm; Manufacturer: Ningbo Kangnex Elec; Manufacturer Part Number: WJ500V-5.08-2P; LCSC Part Number: C8465; ComponentLink1Description: LCSC; ComponentLink1URL: https://www.lcsc.com/product-detail/Screw-span-style-background-color-ff0-terminal-span_Ningbo-Kangnex-Elec-WJ500V-5-08-2P_C8465.html
LED1-LED12 = NCD0603G2: Emerald 0603 Light Emitting Diodes (LED) ROHS; Manufacturer: Foshan NationStar Optoelectronics; Manufacturer Part Number: NCD0603G2; Package: 0603; LCSC Part Number: C87326; Item Type: LED; ComponentLink1Description: LCSC; ComponentLink1URL: https://www.lcsc.com/product-detail/Light-Emitting-Diodes-LED_Foshan-NationStar-Optoelectronics-NCD0603G2_C87326.html
R24-R26 R39 R41 R43 R51-R59 R72 R74 R76 R84-R89 = RC0402FR-074K7L: RES 4.7K OHM 1% 1/16W 0402; Manufacturer: Yageo; Voltage Rating (DC): 50V; Power Rating: 62.5mW; Resistance: 4.7kR; Temperature Coefficient: 100ppm/°C; Max Power Dissipation: 63mW; Item Type: Resistor; Supplier 1: Avnet; Manufacturer Part Number: RC0402FR-074K7L; RoHS: Yes; Category: Chip SMD Resistors; Stock 1: 2420000; Pricing 1: 10000=0.00085 (USD); Case/Package: 0402; Number of Pins: 2; Case Code (Imperial): 0402; Case Code (Metric): 1005; Size Code: 0402; Min Operating Temperature: -55°C; Max Operating Temperature: 155°C; Tolerance: 1%; Voltage Rating: 50V; Packaging: Tape and Reel; Resistor Type: Thick Film; Termination: SMD/SMT; Features: Moisture Resistant; Series: RC; Number of Terminations: 2; Resistance Tolerance: 1%; Construction: Rectangular; Length: 1mm; Width: 0.5mm; Height: 0.32mm; Depth: 0.5mm; Height - Seated (Max): 0.016inch; RoHS Compliant: Yes; Reach SVHC Compliant: Yes; Military Standard: Not; Lead Free: Lead Free; ComponentLink1URL: https://datasheet.ciiva.com/22661/1686128-22661342.pdf?src-supplier=Element14; ComponentLink1Description: https://datasheet.ciiva.com/22661/1686128-22661342.pdf?src-supplier=Element14; ComponentLink2URL: https://datasheet.ciiva.com/7850/1018594-7850022.pdf?src-supplier=Element14; ComponentLink2Description: https://datasheet.ciiva.com/7850/1018594-7850022.pdf?src-supplier=Element14; ComponentLink3URL: https://datasheet.ciiva.com/7850/1018594-7850023.pdf?src-supplier=Element14; ComponentLink3Description: https://datasheet.ciiva.com/7850/1018594-7850023.pdf?src-supplier=Element14; ComponentLink4URL: https://datasheet.ciiva.com/15215/getdatasheetpartid-328119-15215035.pdf?src-supplier=Verical; ComponentLink4Description: https://datasheet.ciiva.com/15215/getdatasheetpartid-328119-15215035.pdf?src-supplier=Verical; Supplier Part Number 1: RC0402FR-074K7L; LCSC Part Number: C105871
R27-R32 R60-R65 = RC0402FR-072K4L: RES 2.4K OHM 1% 1/16W 0402; Manufacturer: Yageo; Value: 2.4kR; Power Rating: 63mW; Voltage Rating: 50V; Temperature Coefficient: 100ppm/°C; Item Type: Resistor; Supplier 1: Future Electronics; Manufacturer Part Number: RC0402FR-072K4L; RoHS: Yes; Category: Chip SMD Resistors; Stock 1: 20000; Pricing 1: 10000=0.001, 50000=0.001, 200000=0.0009, 300000=0.0009, 750000=0.0009, 1000000=0.0009, 2000000=0.0009, 3000000=0.0008, 7500000=0.0008 (USD); Case/Package: 0402; Case Code (Metric): 1005; Case Code (Imperial): 0402; Min Operating Temperature: -55°C; Max Operating Temperature: 155°C; Packaging: Tape and Reel; Tolerance: 1%; Package Quantity: 1; Resistor Type: Thick Film; Number of Terminations: 2; Termination: SMD/SMT; Max Power Dissipation: 63mW; Voltage Rating (DC): 50V; Features: Moisture Resistant; Series: RC; Construction: Rectangular; Resistance Tolerance: 1%; Length: 0.039inch; Width: 0.02inch; Height: 0.016inch; Depth: 0.5mm; Military Standard: Not; Lead Free: Lead Free; RoHS Compliant: Yes; Reach SVHC Compliant: Unknown; ComponentLink1URL: https://datasheet.ciiva.com/7849/1018594-7849930.pdf?src-supplier=Element14; ComponentLink1Description: https://datasheet.ciiva.com/7849/1018594-7849930.pdf?src-supplier=Element14; ComponentLink2URL: https://datasheet.ciiva.com/7849/1018594-7849931.pdf?src-supplier=Element14; ComponentLink2Description: https://datasheet.ciiva.com/7849/1018594-7849931.pdf?src-supplier=Element14; ComponentLink3URL: https://datasheet.ciiva.com/2453/pyu-r-int-thick-7-2453428.pdf?src-supplier=Digi-Key; ComponentLink3Description: https://datasheet.ciiva.com/2453/pyu-r-int-thick-7-2453428.pdf?src-supplier=Digi-Key; ComponentLink4URL: https://datasheet.ciiva.com/2453/pyu-r-int-thick-7-2453429.pdf?src-supplier=Digi-Key; ComponentLink4Description: https://datasheet.ciiva.com/2453/pyu-r-int-thick-7-2453429.pdf?src-supplier=Digi-Key; ComponentLink5URL: https://datasheet.ciiva.com/2453/pyu-r-int-thick-7-2453427.pdf?src-supplier=Digi-Key; ComponentLink5Description: https://datasheet.ciiva.com/2453/pyu-r-int-thick-7-2453427.pdf?src-supplier=Digi-Key; ComponentLink6URL: https://datasheet.ciiva.com/12667/pyu-rc0402-51-rohs-l-6-r-12667437.pdf?src-supplier=Mouser; ComponentLink6Description: https://datasheet.ciiva.com/12667/pyu-rc0402-51-rohs-l-6-r-12667437.pdf?src-supplier=Mouser; ComponentLink7URL: https://datasheet.ciiva.com/17423/pyu-rc0402-51-rohs-l-6-r-17423915.pdf?src-supplier=Future+Electronics; ComponentLink7Description: https://datasheet.ciiva.com/17423/pyu-rc0402-51-rohs-l-6-r-17423915.pdf?src-supplier=Future+Electronics; Supplier Part Number 1: 3635539; LCSC Part Number: C112296
R33-R35 R66-R68 = RC0402FR-0756KL: RES 56K OHM 1% 1/16W 0402; Manufacturer: Yageo; Power Rating: 62.5mW; Temperature Coefficient: 100ppm/°C; Value: 56kR; Voltage Rating: 50V; Max Power Dissipation: 63mW; Item Type: Resistor; Supplier 1: Future Electronics; Manufacturer Part Number: RC0402FR-0756KL; RoHS: Yes; Category: Chip SMD Resistors; Stock 1: 2610000; Pricing 1: 10000=0.001, 50000=0.001, 300000=0.0009, 1000000=0.0009, 3000000=0.0008 (USD); Case/Package: 0402; Case Code (Metric): 1005; Case Code (Imperial): 0402; Min Operating Temperature: -55°C; Max Operating Temperature: 155°C; Tolerance: 1%; Series: RC; Technology: THICK FILM; Package Quantity: 1; Packaging: Tape and Reel; Resistor Type: Thick Film; Number of Terminations: 2; Termination: SMD/SMT; Working Voltage: 50V; Features: Moisture Resistant; Construction: Rectangular; Resistance Tolerance: 1%; Length: 0.039inch; Width: 0.02inch; Height: 0.016inch; Depth: 0.5mm; RoHS Compliant: Yes; Reach SVHC Compliant: No; Military Standard: Not; Lead Free: Lead Free; ComponentLink1URL: https://datasheet.ciiva.com/46412/1018594-46412840.pdf?src-supplier=Element14; ComponentLink1Description: https://datasheet.ciiva.com/46412/1018594-46412840.pdf?src-supplier=Element14; ComponentLink2URL: https://datasheet.ciiva.com/2453/pyu-r-int-thick-7-2453479.pdf?src-supplier=Digi-Key; ComponentLink2Description: https://datasheet.ciiva.com/2453/pyu-r-int-thick-7-2453479.pdf?src-supplier=Digi-Key; ComponentLink3URL: https://datasheet.ciiva.com/2453/pyu-r-int-thick-7-2453480.pdf?src-supplier=Digi-Key; ComponentLink3Description: https://datasheet.ciiva.com/2453/pyu-r-int-thick-7-2453480.pdf?src-supplier=Digi-Key; ComponentLink4URL: https://datasheet.ciiva.com/2453/pyu-r-int-thick-7-2453478.pdf?src-supplier=Digi-Key; ComponentLink4Description: https://datasheet.ciiva.com/2453/pyu-r-int-thick-7-2453478.pdf?src-supplier=Digi-Key; ComponentLink5URL: https://datasheet.ciiva.com/5558/pyu-rc0402-51-rohs-l-6-r-5558279.pdf?src-supplier=Mouser; ComponentLink5Description: https://datasheet.ciiva.com/5558/pyu-rc0402-51-rohs-l-6-r-5558279.pdf?src-supplier=Mouser; ComponentLink6URL: https://datasheet.ciiva.com/7850/1018594-7850045.pdf?src-supplier=Element14; ComponentLink6Description: https://datasheet.ciiva.com/7850/1018594-7850045.pdf?src-supplier=Element14; ComponentLink7URL: https://datasheet.ciiva.com/7850/1018594-7850044.pdf?src-supplier=Element14; ComponentLink7Description: https://datasheet.ciiva.com/7850/1018594-7850044.pdf?src-supplier=Element14; Supplier Part Number 1: 3873767; LCSC Part Number: C114756
R36-R38 R40 R42 R44-R47 R69-R71 R73 R75 R77-R80 = RC0402FR-070RL: RES 0 OHM JUMPER 1/16W 0402; Manufacturer: Yageo; Tolerance: 1%; Power Rating: 62.5mW; Voltage Rating: 50V; Temperature Coefficient: 200ppm/°C; Max Power Dissipation: 63mW; Supplier 1: Mouser; Manufacturer Part Number: RC0402FR-070RL; RoHS: Yes; Category: Chip SMD Resistors; Stock 1: 8556842; Pricing 1: 1=0.10000, 10=0.01400, 50=0.01400, 100=0.00600, 1000=0.00300, 5000=0.00200, 10000=0.00100 (USD); Mount: Surface Mount; Case/Package: 0402; Contact Plating: Tin,Matte; Case Code (Imperial): 0402; Case Code (Metric): 1005; Size Code: 0402; Min Operating Temperature: -55°C; Max Operating Temperature: 155°C; Resistance: 0R; Resistor Type: Thick Film; Packaging: Tape and Reel; Termination: SMD/SMT; Features: Moisture Resistant; Series: RC; Number of Terminations: 2; Length: 1mm; Width: 0.5mm; Height: 0.35mm; Radiation Hardening: No; Lead Free: Lead Free; RoHS Compliant: Yes; ComponentLink1URL: https://datasheet.ciiva.com/8896/pyu-rc0402-51-rohs-l-6-8896149.pdf?src-supplier=Avnet; ComponentLink1Description: https://datasheet.ciiva.com/8896/pyu-rc0402-51-rohs-l-6-8896149.pdf?src-supplier=Avnet; ComponentLink2URL: https://datasheet.ciiva.com/16790/pyu-rc0402-51-rohs-l-6-r-16790444.pdf?src-supplier=Future+Electronics; ComponentLink2Description: https://datasheet.ciiva.com/16790/pyu-rc0402-51-rohs-l-6-r-16790444.pdf?src-supplier=Future+Electronics; Supplier Part Number 1: 603-RC0402FR-070RL; LCSC Part Number: C106231
R48-R50 R81-R83 = RC0603FR-07120RL: RES 120 OHM 1% 1/10W 0603; Manufacturer: Yageo; Temperature Coefficient: 100ppm/°C; Voltage Rating (DC): 50V; Power Rating: 100mW; Supplier 1: Digi-Key; Manufacturer Part Number: RC0603FR-07120RL; RoHS: Yes; Category: Chip SMD Resistors; Stock 1: 839061; Pricing 1: 1=0.10000, 10=0.02400, 100=0.00970, 1000=0.00436, 2500=0.00378 (USD); Case/Package: 0603; Number of Pins: 2; Case Code (Metric): 1608; Case Code (Imperial): 0603; Size Code: 0603; Min Operating Temperature: -55°C; Max Operating Temperature: 155°C; Resistance: 120R; Tolerance: 1%; Resistor Type: Thick Film; Packaging: Tape and Reel; Voltage Rating: 50V; Package Quantity: 1; Number of Terminations: 2; Termination: SMD/SMT; Max Power Dissipation: 100mW; Features: Moisture Resistant; Series: RC; Construction: Rectangular; Resistance Tolerance: 1%; Length: 1.6mm; Width: 0.031inch; Height: 0.022inch; Depth: 0.8mm; REACH SVHC: No SVHC; Lead Free: Lead Free; Military Standard: Not; RoHS Compliant: Yes; ComponentLink1URL: https://datasheet.ciiva.com/2553/pyu-r-int-thick-7-2553512.pdf?src-supplier=Digi-Key; ComponentLink1Description: https://datasheet.ciiva.com/2553/pyu-r-int-thick-7-2553512.pdf?src-supplier=Digi-Key; ComponentLink2URL: https://datasheet.ciiva.com/7746/443971-7746248.pdf?src-supplier=Element14; ComponentLink2Description: https://datasheet.ciiva.com/7746/443971-7746248.pdf?src-supplier=Element14; ComponentLink3URL: https://datasheet.ciiva.com/2553/pyu-r-int-thick-7-2553513.pdf?src-supplier=Digi-Key; ComponentLink3Description: https://datasheet.ciiva.com/2553/pyu-r-int-thick-7-2553513.pdf?src-supplier=Digi-Key; ComponentLink4URL: https://datasheet.ciiva.com/7746/443971-7746249.pdf?src-supplier=Element14; ComponentLink4Description: https://datasheet.ciiva.com/7746/443971-7746249.pdf?src-supplier=Element14; ComponentLink5URL: https://datasheet.ciiva.com/2553/pyu-r-int-thick-7-2553514.pdf?src-supplier=Digi-Key; ComponentLink5Description: https://datasheet.ciiva.com/2553/pyu-r-int-thick-7-2553514.pdf?src-supplier=Digi-Key; ComponentLink6URL: https://datasheet.ciiva.com/46395/443971-46395021.pdf?src-supplier=Element14; ComponentLink6Description: https://datasheet.ciiva.com/46395/443971-46395021.pdf?src-supplier=Element14; Supplier Part Number 1: 311-120HRCT-ND; LCSC Part Number: C114640
SB3-SB20 = Solder Bridge 0402: Solder Bridge ON; Manufacturer Part Number: Solder Bridge 0402; Item Type: Solder Bridge
U8-U10 U14-U16 = SN74HC04NSR: 6 16ns@6V,50pF 2uA 2V~6V SOIC-14-208mil Inverters ROHS; Manufacturer: Texas Instruments; Max Supply Voltage: 6V; Min Supply Voltage: 2V; Number of Inputs: 1; Propagation Delay: 120ns; Logic Function: Buffer,Inverter; Number of Elements: 6; High Level Output Current: -5.2mA; Low Level Output Current: 5.2mA; Turn-On Delay Time: 20ns; Operating Supply Voltage: 5V; Item Type: IC; Supplier 1: Digi-Key; Manufacturer Part Number: SN74HC04NSR; RoHS: Yes; Category: Logic Gates; Stock 1: 1936; Pricing 1: 1=0.74, 10=0.65, 25=0.6108, 100=0.4984, 250=0.46296, 500=0.394, 1000=0.3152 (USD); Mounting Technology: Surface Mount; Case/Package: SOP; Pins: 14; Weight: 0.007348oz; Min Operating Temperature: -40°C; Max Operating Temperature: 85°C; Packaging: Tape and Reel; Package Quantity: 1; Number of Circuits: 6; Quiescent Current: 2uA; Number of Gates: 6; Number of Bits: 6; Series: 74HC; Technology: CMOS; Radiation Hardening: No; Lead Free: Lead Free; RoHS Compliant: Yes; Reach SVHC Compliant: No; ComponentLink1URL: https://datasheet.ciiva.com/15089/getdatasheetpartid-409522-15089683.pdf?src-supplier=Verical; ComponentLink1Description: https://datasheet.ciiva.com/15089/getdatasheetpartid-409522-15089683.pdf?src-supplier=Verical; ComponentLink2URL: https://datasheet.ciiva.com/46439/1834038-46439813.pdf?src-supplier=Element14; ComponentLink2Description: https://datasheet.ciiva.com/46439/1834038-46439813.pdf?src-supplier=Element14; ComponentLink3URL: https://datasheet.ciiva.com/1864/sn74hc04-1864851.pdf?src-supplier=Digi-Key; ComponentLink3Description: https://datasheet.ciiva.com/1864/sn74hc04-1864851.pdf?src-supplier=Digi-Key; ComponentLink4URL: https://datasheet.ciiva.com/1864/sn74hc04-1864850.pdf?src-supplier=Digi-Key; ComponentLink4Description: https://datasheet.ciiva.com/1864/sn74hc04-1864850.pdf?src-supplier=Digi-Key; ComponentLink5URL: https://datasheet.ciiva.com/1864/sn74hc04-1864852.pdf?src-supplier=Digi-Key; ComponentLink5Description: https://datasheet.ciiva.com/1864/sn74hc04-1864852.pdf?src-supplier=Digi-Key; ComponentLink6URL: https://datasheet.ciiva.com/14292/sn54hc04-sp-14292233.pdf?src-supplier=Avnet; ComponentLink6Description: https://datasheet.ciiva.com/14292/sn54hc04-sp-14292233.pdf?src-supplier=Avnet; ComponentLink7URL: https://datasheet.ciiva.com/14288/sn54hc04-sp-14288839.pdf?src-supplier=Avnet; ComponentLink7Description: https://datasheet.ciiva.com/14288/sn54hc04-sp-14288839.pdf?src-supplier=Avnet; Supplier Part Number 1: 296-12883-1-ND; LCSC Part Number: C6812
U11-U13 U17-U19 = SP3485EIM/TR: SOP-8 RS-485/RS-422 ICs ROHS; Manufacturer: HGSEMI; Item Type: IC; Manufacturer Part Number: SP3485EIM/TR; Package: SOP-8; LCSC Part Number: C519086; ComponentLink1Description: LCSC; ComponentLink1URL: https://www.lcsc.com/product-detail/RS-485-RS-422-ICs_HGSEMI-SP3485EIM-TR_C519086.html